# EasyEDA Pro project Hexbie.epro

# Schematic Sheet_1_2026-10-25
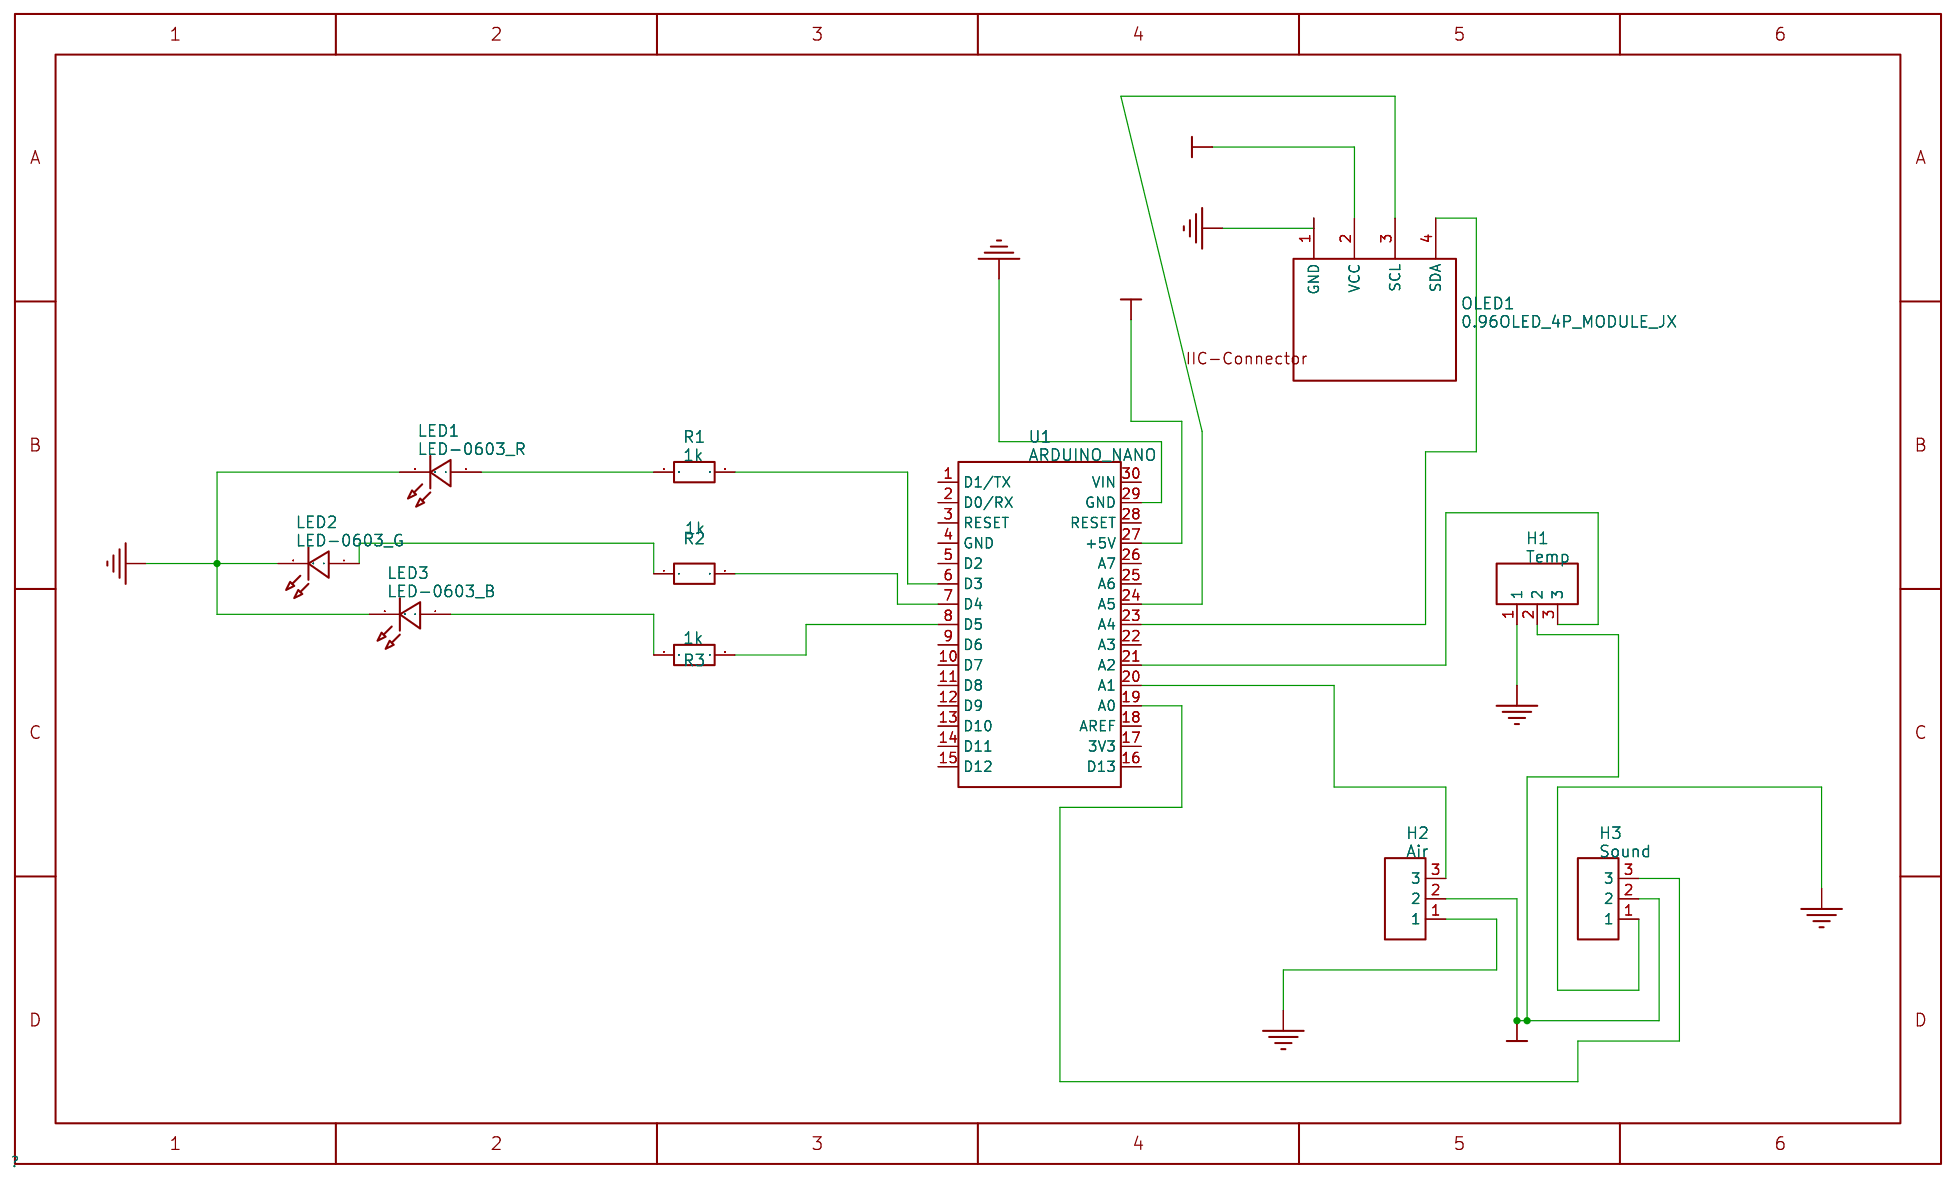
[diagram p0: schematic sheet]

## Parts
H1  Temp
H2  Air
H3  Sound
LED1  LED-0603_R
LED2  LED-0603_G
LED3  LED-0603_B
OLED1  0.96OLED_4P_MODULE_JX
R1  1k
R2  1k
R3  1k
U1  ARDUINO_NANO

## Library data of the parts
H1 = Temp: Supplier: LCSC; Supplier Part: C52016391; Manufacturer: hanxia(韩下); Manufacturer Part: HX PH254-01-03-Z-L11.5 pcb pin header; JLCPCB Part Class: Extended Part; Contributor: lcsc; spicePre: H; spiceSymbolName: HX PH254-01-03-Z-L11.5 PCB PIN HEADER; OriginFootprint 2: HDR-TH_3P-P2.54-V-M-1
H2 = Air: Supplier: LCSC; Supplier Part: C52016391; Manufacturer: hanxia(韩下); Manufacturer Part: HX PH254-01-03-Z-L11.5 pcb pin header; JLCPCB Part Class: Extended Part; Contributor: lcsc; spicePre: H; spiceSymbolName: HX PH254-01-03-Z-L11.5 PCB PIN HEADER; OriginFootprint 2: HDR-TH_3P-P2.54-V-M-1
H3 = Sound: Supplier: LCSC; Supplier Part: C52016391; Manufacturer: hanxia(韩下); Manufacturer Part: HX PH254-01-03-Z-L11.5 pcb pin header; JLCPCB Part Class: Extended Part; Contributor: lcsc; spicePre: H; spiceSymbolName: HX PH254-01-03-Z-L11.5 PCB PIN HEADER; OriginFootprint 2: HDR-TH_3P-P2.54-V-M-1
LED1 = LED-0603_R: Manufacturer: EVERLIGHT(台湾亿光); Manufacturer Part: 19-217/R6C-AL1M2VY/3T; Supplier Part: C72044; Supplier: LCSC; Contributor: LCEDA_01; spicePre: L; OriginFootprint 2: LED0603_RED
LED2 = LED-0603_G: Manufacturer: EVERLIGHT(台湾亿光); Manufacturer Part: 19-217/GHC-YR1S2/3T; Supplier Part: C72043; Supplier: LCSC; Contributor: LCEDA_Lib; spicePre: L; OriginFootprint 2: LED0603_GREEN
LED3 = LED-0603_B: Manufacturer: EVERLIGHT(台湾亿光); Manufacturer Part: 19-217/BHC-ZL1M2RY/3T; Supplier Part: C72041; Supplier: LCSC; Contributor: LCEDA_01; spicePre: L; OriginFootprint 2: LED0603_BLUE
OLED1 = 0.96OLED_4P_MODULE_JX: Contributor: LCSC; Supplier: LCSC; Supplier Part: C9900004566; Manufacturer: null; JLCPCB Part Class: Extended Part; spicePre: O; OriginFootprint 2: 0.96OLED_4P
R1-R3 = 1k: nameAlias: Value(Ω); Contributor: LCEDA_Lib; spicePre: R; spiceSymbolName: R_0603_EU; OriginFootprint 2: R0603
U1 = ARDUINO_NANO: Contributor: lcsc; Supplier: LCSC; Supplier Part: C9900017879; Manufacturer: null; JLCPCB Part Class: Extended Part; spicePre: U; OriginFootprint 2: COMM-TH_ARDUINO_NANO

## Nets
GND: H1.1 H2.1 H3.1 LED1.2 LED2.2 LED3.2 OLED1.1(GND) U1.29(GND)
VCC: H1.2 H2.2 H3.2 OLED1.2(VCC) U1.27(+5V)
Net-(H1-3): H1.3 U1.21(A2)
Net-(H2-3): H2.3 U1.20(A1)
Net-(H3-3): H3.3 U1.19(A0)
Net-(LED1-1): LED1.1 R1.1
Net-(LED2-1): LED2.1 R2.1
Net-(LED3-1): LED3.1 R3.1
Net-(OLED1-3): OLED1.3(SCL) U1.24(A5)
Net-(OLED1-4): OLED1.4(SDA) U1.23(A4)
Net-(R1-2): R1.2 U1.6(D3)
Net-(R2-2): R2.2 U1.7(D4)
Net-(R3-2): R3.2 U1.8(D5)

Not connected (* = marked no-connect by the designer): U1 1(D1/TX) 2(D0/RX) 3(RESET) 4(GND) 5(D2) 9(D6) 10(D7) 11(D8) 12(D9) 13(D10) 14(D11) 15(D12) 16(D13) 17(3V3) 18(AREF) 22(A3) 25(A6) 26(A7) 28(RESET) 30(VIN)
